# Altium schematic sheet 5V_to_3V3.SchDoc: 5V_to_3V3
size A4
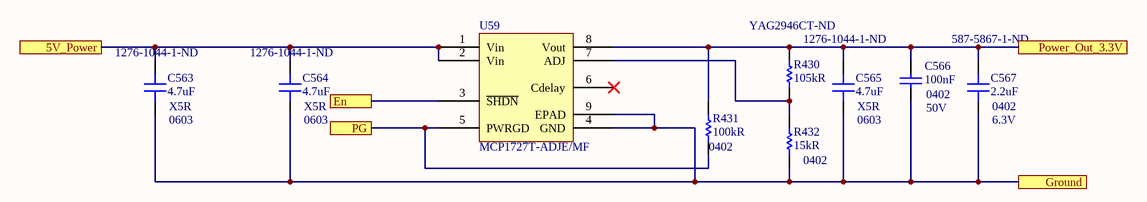
[diagram p0: 5V_to_3V3.SchDoc]

## Parts
C563  4.7uF  Supplier Part Number 1: 1276-1044-1-ND  Case/Package: 0603  Dielectric: X5R  [CAP 0603/1608 RF]
C564  4.7uF  Supplier Part Number 1: 1276-1044-1-ND  Case/Package: 0603  Dielectric: X5R  [CAP 0603/1608 RF]
C565  4.7uF  Supplier Part Number 1: 1276-1044-1-ND  Case/Package: 0603  Dielectric: X5R  [CAP 0603/1608 RF]
C566  100nF  Case Code (Imperial): 0402  Voltage: 50V  [CAP 0402/1005 KK]
C567  2.2uF  Supplier Part Number 1: 587-5867-1-ND  Case Code (Imperial): 0402  Voltage Rating: 6.3V  [CAP 0402/1005 KK]
R430  105kR  Supplier Part Number 1: YAG2946CT-ND  [RES 0402/1005 RF KK]
R431  100kR  Case/Package: 0402  [RES 0402/1005 RF KK]
R432  15kR  Case Code (Imperial): 0402  [RES 0402/1005 RF KK]
U59  MCP1727T-ADJE/MF  [MCP1727T-ADJE/MF]

## Ports
5V_Power, En, Ground, PG, Power_Out_3.3V

## Nets
5V_Power: C563.2 C564.2 U59.1(Vin) U59.2(Vin) ; port 5V_Power
En: U59.3(~{SHDN}) ; port En
Ground: C563.1 C564.1 C565.1 C566.1 C567.1 R432.1 U59.4(GND) U59.9(EPAD) ; port Ground
PG: R431.1 U59.5(PWRGD) ; port PG
Power_Out_3.3V: C565.2 C566.2 C567.2 R430.2 R431.2 U59.8(Vout) ; port Power_Out_3.3V
NetR430_1: R430.1 R432.2 U59.7(ADJ)

Not connected (* = marked no-connect by the designer): U59 6(Cdelay)*

## Notes on the sheet
- Title
- Size:
- Date:
- A3
- Number:
- Time:
- Revision:
- Sheet
- of
- File:

## Library data of the parts
C563-C565 = Capacitor: Manufacturer: Samsung; Manufacturer Part Number: CL10A475KP8NNNC; Tolerance: 10%; Voltage Rating: 10V; Supplier 1: Digi-Key; Stock 1: 2124648; Pricing 1: 1 = 0,13000, 10 = 0,09600, 100 = 0,04520, 500 = 0,03168, 1000 = 0,02622 (USD); RoHS: Yes; Mount: Surface Mount; Case Code (Metric): 1608; Case Code (Imperial): 0603; Contact Plating: Tin; Min Operating Temperature: -55°C; Max Operating Temperature: 85°C; Capacitance: 4.7uF; Package Quantity: 1; Packaging: Tape and Reel; Length: 1.6mm; Height: 0.8mm; Width: 0.031inch; Thickness: 0.035inch; Depth: 0.8mm; Radiation Hardening: No; ComponentLink1URL: https://datasheet.ciiva.com/25797/cl10a475kp8nnnc-25797520.pdf?src-supplier=Digi-Key; ComponentLink1Description: https://datasheet.ciiva.com/25797/cl10a475kp8nnnc-25797520.pdf?src-supplier=Digi-Key; ComponentLink2URL: https://datasheet.ciiva.com/26838/getdatasheetpartid-358676-26838384.pdf?src-supplier=Verical; ComponentLink2Description: https://datasheet.ciiva.com/26838/getdatasheetpartid-358676-26838384.pdf?src-supplier=Verical; ComponentLink3URL: https://datasheet.ciiva.com/16318/cl05b104kq5nnnc-16318245.pdf?src-supplier=Future+Electronics; ComponentLink3Description: https://datasheet.ciiva.com/16318/cl05b104kq5nnnc-16318245.pdf?src-supplier=Future+Electronics
C566 = Capacitor: CAP CER 0.1UF 50V X5R 0402; Manufacturer: Murata; Manufacturer Part Number: GRM155R61H104KE14D; Dielectric Material: Ceramic; Dissipation Factor: 0.025%; Tolerance: 10%; Supplier 1: Digi-Key; Supplier Part Number 1: 490-10697-1-ND; RoHS: Yes; Category: Ceramic Capacitors; Stock 1: 435607; Pricing 1: 1=0,10000, 10=0,04600, 100=0,02050, 500=0,01464, 1000=0,01150, 2500=0,01045, 5000=0,00961 (USD); Mount: Surface Mount; Case/Package: 0402; Weight: 0.000212oz; Case Code (Metric): 1005; Min Operating Temperature: -55°C; Max Operating Temperature: 85°C; Capacitance: 100nF; Packaging: Tape and Reel; Voltage Rating: 50V; Dielectric: X5R; Termination: SMD/SMT; Composition: Ceramic; Voltage Rating (DC): 50V; Package Quantity: 10000; Length: 1mm; Height: 0.5mm; Width: 0.02inch; Thickness: 0.022inch; Depth: 0.5mm; REACH SVHC: No SVHC; Lead Free: Lead Free; ComponentLink1URL: http://www.farnell.com/datasheets/2079150.pdf?src-supplier=Farnell; ComponentLink1Description: http://www.farnell.com/datasheets/2079150.pdf?src-supplier=Farnell; ComponentLink2URL: http://www.mouser.com/ds/2/281/c02e-2905.pdf?src-supplier=Mouser; ComponentLink2Description: http://www.mouser.com/ds/2/281/c02e-2905.pdf?src-supplier=Mouser; ComponentLink3URL: http://www.farnell.com/datasheets/2079150.pdf?src-supplier=Element14; ComponentLink3Description: http://www.farnell.com/datasheets/2079150.pdf?src-supplier=Element14; ComponentLink4URL: http://search.murata.co.jp/Ceramy/image/img/A01X/G101/ENG/GRM155R61H104KE14-01.pdf?src-supplier=Digi-Key; ComponentLink4Description: http://search.murata.co.jp/Ceramy/image/img/A01X/G101/ENG/GRM155R61H104KE14-01.pdf?src-supplier=Digi-Key
C567 = Capacitor: CAP CER 2.2UF 6.3V X5R 0402; Manufacturer: Taiyo Yuden; Manufacturer Part Number: JMK105BJ225KV-F; Tolerance: 10%; Supplier 1: Digi-Key; RoHS: Yes; Category: Ceramic Capacitors; Stock 1: 4812; Pricing 1: 1=0,10000, 10=0,06000, 100=0,02650, 500=0,01894, 1000=0,01488, 2500=0,01352, 5000=0,01244 (USD); Mount: Surface Mount; Case/Package: 0402; Case Code (Metric): 1005; Min Operating Temperature: -55°C; Max Operating Temperature: 85°C; Packaging: Tape and Reel; Capacitance: 2.2uF; Package Quantity: 10000; Voltage Rating (DC): 6.3V; Dielectric: X5R; Termination: SMD/SMT; Composition: Ceramic; Length: 1mm; Height: 0.5mm; Width: 0.5mm; Thickness: 0.022inch; Depth: 0.5mm; Radiation Hardening: No; ComponentLink1URL: https://datasheet.ciiva.com/15921/tmk105b7103kv-15921011.pdf?src-supplier=Onlinecomponents.com; ComponentLink1Description: https://datasheet.ciiva.com/15921/tmk105b7103kv-15921011.pdf?src-supplier=Onlinecomponents.com; ComponentLink2URL: https://datasheet.ciiva.com/30178/cmultilayerceramiccapacitor-30178599.pdf?src-supplier=Onlinecomponents.com; ComponentLink2Description: https://datasheet.ciiva.com/30178/cmultilayerceramiccapacitor-30178599.pdf?src-supplier=Onlinecomponents.com
R430 = Resistor: Thick Film Resistors - SMD 105K OHM 1%; Manufacturer: Yageo; Manufacturer Part Number: RC0402FR-07105KL; Power Rating: 62.5mW; Voltage Rating: 50V; Max Power Dissipation: 63mW; Temperature Coefficient: 100ppm/°C; Supplier 1: Digi-Key; RoHS: Yes; Category: Chip SMD Resistors; Stock 1: 641531; Pricing 1: 1=0,10000, 10=0,01600, 100=0,00640, 1000=0,00289, 2500=0,00251, 5000=0,00207 (USD); Case/Package: 0402; Case Code (Imperial): 0402; Case Code (Metric): 1005; Contact Plating: Tin,Lead,Matte; Min Operating Temperature: -55°C; Max Operating Temperature: 155°C; Tolerance: 1%; Resistance: 105kR; Packaging: Tape and Reel; Composition: Thick Film; Number of Terminations: 2; Termination: SMD/SMT; Military Standard: Not; Features: Moisture Resistant; Length: 1mm; Height: 0.016inch; Width: 0.02inch; Depth: 0.5mm; Radiation Hardening: No; Lead Free: Lead Free; ComponentLink1URL: https://datasheet.ciiva.com/16869/pyu-rc0402-51-rohs-l-6-16869544.pdf?src-supplier=Avnet+Europe; ComponentLink1Description: https://datasheet.ciiva.com/16869/pyu-rc0402-51-rohs-l-6-16869544.pdf?src-supplier=Avnet+Europe; ComponentLink2URL: https://datasheet.ciiva.com/12575/pyu-rc0402-51-rohs-l-6-r-8721-12575887.pdf?src-supplier=Mouser; ComponentLink2Description: https://datasheet.ciiva.com/12575/pyu-rc0402-51-rohs-l-6-r-8721-12575887.pdf?src-supplier=Mouser; ComponentLink3URL: https://datasheet.ciiva.com/8887/pyu-rc0402-51-rohs-l-6-8887815.pdf?src-supplier=Avnet; ComponentLink3Description: https://datasheet.ciiva.com/8887/pyu-rc0402-51-rohs-l-6-8887815.pdf?src-supplier=Avnet; ComponentLink4URL: https://datasheet.ciiva.com/28395/pyu-rc0402-51-rohs-l-6-28395228.pdf?src-supplier=Avnet+Europe; ComponentLink4Description: https://datasheet.ciiva.com/28395/pyu-rc0402-51-rohs-l-6-28395228.pdf?src-supplier=Avnet+Europe
R431 = Resistor: Manufacturer 1: Panasonic; Manufacturer Part Number 1: ERA-2AED104X; Tolerance: 0.5%; Power Rating: 63mW; Voltage Rating: 25V; Temperature Coefficient: 25ppm/°C; Supplier 1: Digi-Key; Supplier Part Number 1: P100KDECT-ND; Stock 1: 54338; Pricing 1: 1=0.22000, 10=0.18800, 100=0.07350, 1000=0.03077, 2500=0.02820, 5000=0.02564 (USD); RoHS: Yes; Mount: Surface Mount; Case Code (Imperial): 0402; Case Code (Metric): 1005; Contact Plating: Tin; Min Operating Temperature: -55°C; Max Operating Temperature: 155°C; Resistance: 100kR; Packaging: Tape and Reel; Package Quantity: 10000; Composition: Metal Film,Thin Film; Number of Terminations: 2; Military Standard: Not; Termination: SMD/SMT; Max Power Dissipation: 63mW; Voltage Rating (DC): 25V; Length: 1mm; Height: 0.016inch; Width: 0.5mm; Depth: 0.5mm; Radiation Hardening: No; REACH SVHC: No SVHC; Lead Free: Lead Free; ComponentLink1URL: https://datasheet.ciiva.com/24028/aoa0000ce26-197354-24028150.pdf?src-supplier=Mouser; ComponentLink1Description: https://datasheet.ciiva.com/24028/aoa0000ce26-197354-24028150.pdf?src-supplier=Mouser; ComponentLink2URL: https://datasheet.ciiva.com/43470/1776116-43470438.pdf?src-supplier=Farnell; ComponentLink2Description: https://datasheet.ciiva.com/43470/1776116-43470438.pdf?src-supplier=Farnell; ComponentLink3URL: https://datasheet.ciiva.com/7830/1776116-7830920.pdf?src-supplier=Element14; ComponentLink3Description: https://datasheet.ciiva.com/7830/1776116-7830920.pdf?src-supplier=Element14; ComponentLink4URL: https://datasheet.ciiva.com/46378/1776116-46378234.pdf?src-supplier=Element14; ComponentLink4Description: https://datasheet.ciiva.com/46378/1776116-46378234.pdf?src-supplier=Element14; ComponentLink5URL: https://datasheet.ciiva.com/16780/70068849-16780139.pdf?src-supplier=Allied+Electronics; ComponentLink5Description: https://datasheet.ciiva.com/16780/70068849-16780139.pdf?src-supplier=Allied+Electronics; ComponentLink6URL: https://datasheet.ciiva.com/9117/aoa0000ce26-9117229.pdf?src-supplier=Avnet; ComponentLink6Description: https://datasheet.ciiva.com/9117/aoa0000ce26-9117229.pdf?src-supplier=Avnet; ComponentLink7URL: https://datasheet.ciiva.com/16511/aoa0000ce26-16511566.pdf?src-supplier=Avnet+Asia; ComponentLink7Description: https://datasheet.ciiva.com/16511/aoa0000ce26-16511566.pdf?src-supplier=Avnet+Asia; ComponentLink8URL: https://datasheet.ciiva.com/30225/54aoa0000ce26-30225311.pdf?src-supplier=Onlinecomponents.com; ComponentLink8Description: https://datasheet.ciiva.com/30225/54aoa0000ce26-30225311.pdf?src-supplier=Onlinecomponents.com
R432 = Resistor: Manufacturer: Panasonic; Manufacturer Part Number: ERJ-2RKF1502X; Tolerance: 1%; Voltage Rating: 50V; Power Rating: 100mW; Temperature Coefficient: 100ppm/°C; Supplier 1: Digi-Key; Supplier Part Number 1: P15.0KLDKR-ND; Stock 1: 3339464; Pricing 1: 1 = 0,10000, 10 = 0,04100, 100 = 0,01670, 1000 = 0,00751, 2500 = 0,00652, 5000 = 0,00538 (USD); RoHS: Yes; Mount: Surface Mount; Case/Package: 0402; Number of Pins: 2; Weight: 2.8E-05oz; Case Code (Metric): 1005; Contact Plating: Tin; Min Operating Temperature: -55°C; Max Operating Temperature: 155°C; Resistance: 15kR; Packaging: Tape and Reel; Package Quantity: 1; Composition: Thick Film; Termination: SMD/SMT; Number of Terminations: 2; Military Standard: Not; Max Power Dissipation: 100mW; Voltage Rating (DC): 50V; Features: Automotive AEC-Q200; Length: 1mm; Height: 0.35mm; Width: 0.5mm; Depth: 0.5mm; Radiation Hardening: No; REACH SVHC: No SVHC; Lead Free: Lead Free; ComponentLink1URL: https://datasheet.ciiva.com/11821/0900766b80f80784-11821181.pdf?src-supplier=RSComponents; ComponentLink1Description: https://datasheet.ciiva.com/11821/0900766b80f80784-11821181.pdf?src-supplier=RSComponents; ComponentLink2URL: https://datasheet.ciiva.com/16778/70260748-16778682.pdf?src-supplier=Allied+Electronics; ComponentLink2Description: https://datasheet.ciiva.com/16778/70260748-16778682.pdf?src-supplier=Allied+Electronics; ComponentLink3URL: https://datasheet.ciiva.com/46372/1678782-46372862.pdf?src-supplier=Element14; ComponentLink3Description: https://datasheet.ciiva.com/46372/1678782-46372862.pdf?src-supplier=Element14; ComponentLink4URL: https://datasheet.ciiva.com/17211/aoa0000ce2-17211535.pdf?src-supplier=Avnet+Europe; ComponentLink4Description: https://datasheet.ciiva.com/17211/aoa0000ce2-17211535.pdf?src-supplier=Avnet+Europe; ComponentLink5URL: https://datasheet.ciiva.com/46372/1678782-46372863.pdf?src-supplier=Element14; ComponentLink5Description: https://datasheet.ciiva.com/46372/1678782-46372863.pdf?src-supplier=Element14; ComponentLink6URL: https://datasheet.ciiva.com/6138/aoa0000ce2-6138166.pdf?src-supplier=Farnell; ComponentLink6Description: https://datasheet.ciiva.com/6138/aoa0000ce2-6138166.pdf?src-supplier=Farnell; ComponentLink7URL: https://datasheet.ciiva.com/16765/70260748-16765542.pdf?src-supplier=Allied+Electronics; ComponentLink7Description: https://datasheet.ciiva.com/16765/70260748-16765542.pdf?src-supplier=Allied+Electronics; ComponentLink8URL: https://datasheet.ciiva.com/43467/1678782-43467414.pdf?src-supplier=Farnell; ComponentLink8Description: https://datasheet.ciiva.com/43467/1678782-43467414.pdf?src-supplier=Farnell; ComponentLink9URL: https://datasheet.ciiva.com/9193/aoa0000ce2-9193047.pdf?src-supplier=Avnet; ComponentLink9Description: https://datasheet.ciiva.com/9193/aoa0000ce2-9193047.pdf?src-supplier=Avnet; ComponentLink10URL: https://datasheet.ciiva.com/8079/426256-8079609.pdf?src-supplier=Element14; ComponentLink10Description: https://datasheet.ciiva.com/8079/426256-8079609.pdf?src-supplier=Element14; ComponentLink11URL: https://datasheet.ciiva.com/16371/aoa0000ce2-16371499.pdf?src-supplier=Future+Electronics; ComponentLink11Description: https://datasheet.ciiva.com/16371/aoa0000ce2-16371499.pdf?src-supplier=Future+Electronics; ComponentLink12URL: https://datasheet.ciiva.com/22687/1678782-22687068.pdf?src-supplier=Element14; ComponentLink12Description: https://datasheet.ciiva.com/22687/1678782-22687068.pdf?src-supplier=Element14
U59 = MCP1727T-ADJE/MF: IC REG LDO ADJ 1.5A 8DFN; Manufacturer 1: Microchip; Number of Outputs: 1; Min Input Voltage: 2.3V; Max Input Voltage: 6V; Output Voltage: 5V; Dropout Voltage: 330mV; Input Bias Current: 120uA; Reference Voltage: 410mV; Polarity: Positive; Accuracy: 0.5%; Output Type: Adjustable; Supplier 1: Digi-Key; Manufacturer Part Number 1: MCP1727T-ADJE/MF; Stock 1: 9419; Pricing 1: 1=0.84000, 25=0.71080, 100=0.63860 (USD); RoHS: Yes; Mount: Surface Mount; Case/Package: DFN; Contact Plating: Tin,Matte; Min Operating Temperature: -40°C; Max Operating Temperature: 125°C; Package Quantity: 3300; Output Current: 1.5A; Packaging: Tape and Reel; Max Output Current: 1.5A; Quiescent Current: 120uA; Radiation Hardening: No; Lead Free: Lead Free; ComponentLink1URL: https://datasheet.ciiva.com/2057/21999b-2057048.pdf?src-supplier=Digi-Key; ComponentLink1Description: https://datasheet.ciiva.com/2057/21999b-2057048.pdf?src-supplier=Digi-Key; ComponentLink2URL: https://datasheet.ciiva.com/8237/jp027822-8237704.pdf?src-supplier=Avnet; ComponentLink2Description: https://datasheet.ciiva.com/8237/jp027822-8237704.pdf?src-supplier=Avnet; ComponentLink3URL: https://datasheet.ciiva.com/17364/jp027822-17364137.pdf?src-supplier=Avnet+Europe; ComponentLink3Description: https://datasheet.ciiva.com/17364/jp027822-17364137.pdf?src-supplier=Avnet+Europe; Supplier Part Number 1: MCP1727T-ADJE/MFCT-ND